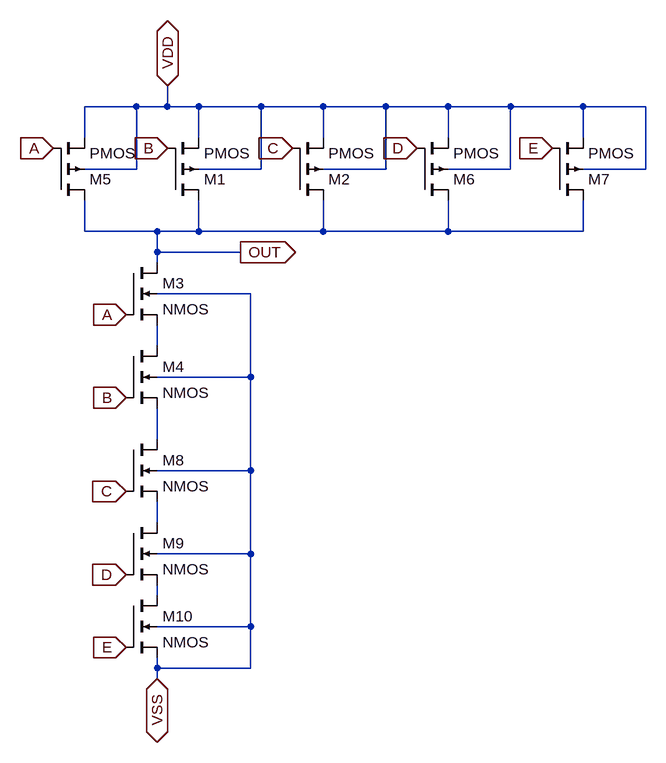
[diagram p0: schematic NAND5.asc]
NAND5.asc, the LTspice schematic file:
Version 4.1
SHEET 1 948 680
WIRE 160 -688 80 -688
WIRE 208 -688 208 -720
WIRE 208 -688 160 -688
WIRE 256 -688 208 -688
WIRE 352 -688 256 -688
WIRE 448 -688 352 -688
WIRE 544 -688 448 -688
WIRE 640 -688 544 -688
WIRE 736 -688 640 -688
WIRE 848 -688 736 -688
WIRE 944 -688 848 -688
WIRE 80 -640 80 -688
WIRE 256 -640 256 -688
WIRE 448 -640 448 -688
WIRE 640 -640 640 -688
WIRE 848 -640 848 -688
WIRE 160 -592 160 -688
WIRE 160 -592 80 -592
WIRE 352 -592 352 -688
WIRE 352 -592 256 -592
WIRE 544 -592 544 -688
WIRE 544 -592 448 -592
WIRE 736 -592 736 -688
WIRE 736 -592 640 -592
WIRE 944 -592 944 -688
WIRE 944 -592 848 -592
WIRE 80 -496 80 -544
WIRE 192 -496 80 -496
WIRE 256 -496 256 -544
WIRE 256 -496 192 -496
WIRE 448 -496 448 -544
WIRE 448 -496 256 -496
WIRE 640 -496 640 -544
WIRE 640 -496 448 -496
WIRE 848 -496 848 -544
WIRE 848 -496 640 -496
WIRE 192 -464 192 -496
WIRE 320 -464 192 -464
WIRE 192 -448 192 -464
WIRE 336 -400 192 -400
WIRE 192 -320 192 -352
WIRE 336 -272 336 -400
WIRE 336 -272 192 -272
WIRE 192 -176 192 -224
WIRE 336 -128 336 -272
WIRE 336 -128 192 -128
WIRE 192 -48 192 -80
WIRE 336 0 336 -128
WIRE 336 0 192 0
WIRE 192 64 192 48
WIRE 336 112 336 0
WIRE 336 112 192 112
WIRE 192 176 192 160
WIRE 336 176 336 112
WIRE 336 176 192 176
WIRE 192 192 192 176
FLAG 208 -720 VDD
IOPIN 208 -720 BiDir
FLAG 192 192 VSS
IOPIN 192 192 BiDir
FLAG 32 -624 A
IOPIN 32 -624 In
FLAG 208 -624 B
IOPIN 208 -624 In
FLAG 144 -368 A
IOPIN 144 -368 In
FLAG 144 -240 B
IOPIN 144 -240 In
FLAG 320 -464 OUT
IOPIN 320 -464 Out
FLAG 400 -624 C
IOPIN 400 -624 In
FLAG 592 -624 D
IOPIN 592 -624 In
FLAG 800 -624 E
IOPIN 800 -624 In
FLAG 144 -96 C
IOPIN 144 -96 In
FLAG 144 32 D
IOPIN 144 32 In
FLAG 144 144 E
IOPIN 144 144 In
SYMBOL nmos4 144 -448 R0
SYMATTR InstName M3
SYMBOL nmos4 144 -320 R0
SYMATTR InstName M4
SYMBOL pmos4 32 -544 M180
SYMATTR InstName M5
SYMBOL pmos4 208 -544 M180
SYMATTR InstName M1
SYMBOL pmos4 400 -544 M180
SYMATTR InstName M2
SYMBOL pmos4 592 -544 M180
SYMATTR InstName M6
SYMBOL pmos4 800 -544 M180
SYMATTR InstName M7
SYMBOL nmos4 144 -176 R0
SYMATTR InstName M8
SYMBOL nmos4 144 -48 R0
SYMATTR InstName M9
SYMBOL nmos4 144 64 R0
SYMATTR InstName M10

The netlist it stands for:
* NAND5.asc
M3 OUT A N001 VSS NMOS
M4 N001 B N002 VSS NMOS
M5 OUT A VDD VDD PMOS
M1 OUT B VDD VDD PMOS
M2 OUT C VDD VDD PMOS
M6 OUT D VDD VDD PMOS
M7 OUT E VDD VDD PMOS
M8 N002 C N003 VSS NMOS
M9 N003 D N004 VSS NMOS
M10 N004 E VSS VSS NMOS
.model NMOS NMOS
.model PMOS PMOS
.lib standard.mos
.backanno
.end